# Altium schematic sheet SPSU_2.SchDoc: SPSU
size 292 x 217 mm; PCB_VERSION: V3.0; Origin: Eagle; Date: 12/02/2024 2:33:38 pm; SheetNumber: 3; SCHEMATIC_VERSION: SCHEMATIC_VERSION; GateName_1: G$1; SymbolName_1: A4L-LOC; LibraryName: frames_corvus; DeviceSetName: A4L-LOC; Sheet: Sheet:
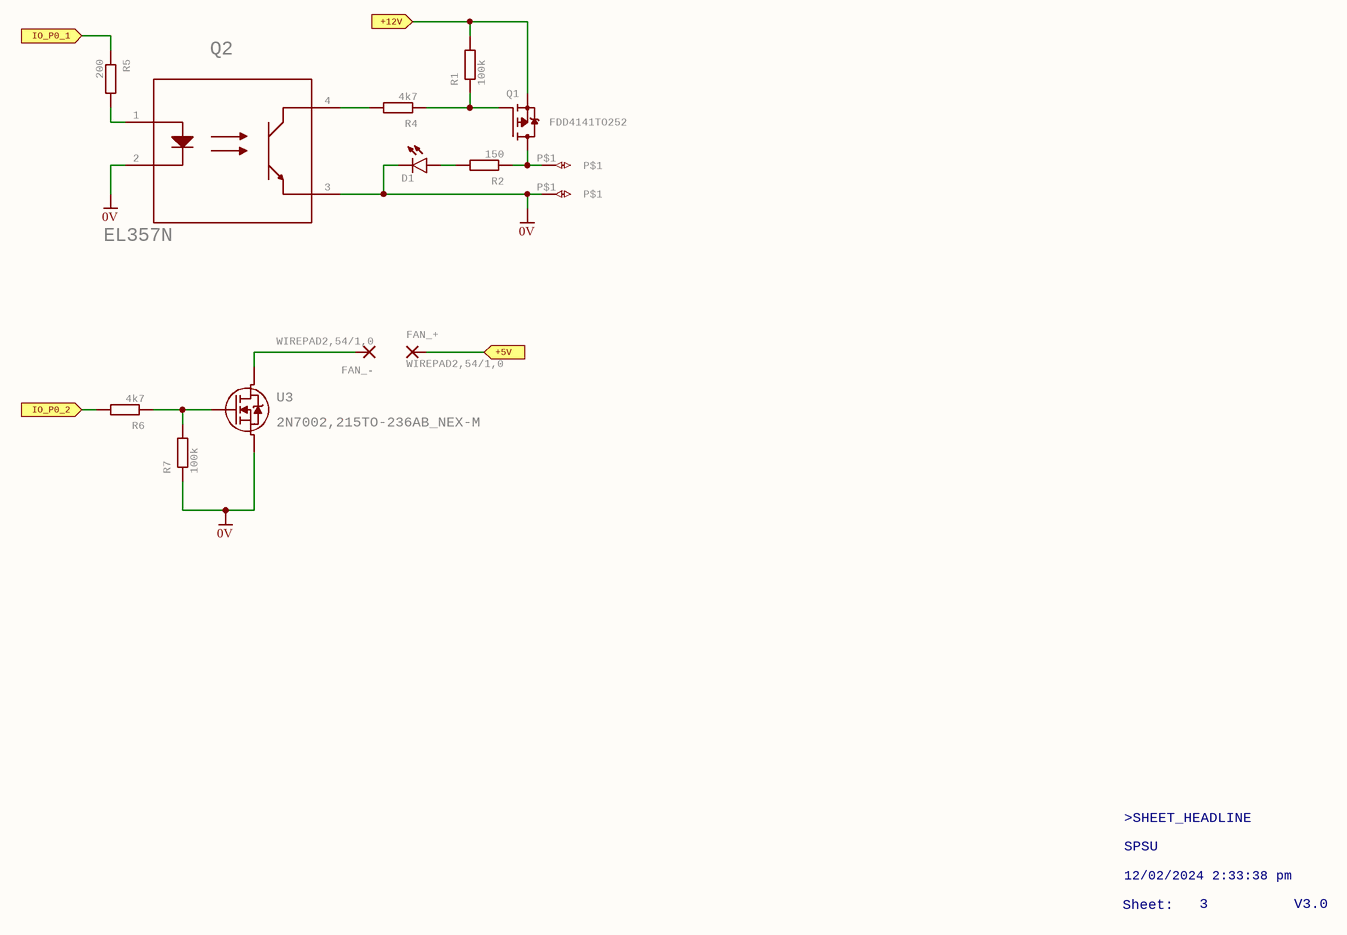
[diagram p0: SPSU_2.SchDoc]

## Parts
D1  LEDCHIPLED_0805  [CHIPLED_0805]  (value not drawn)
ESC+  ESC  [ESC]  (value not drawn)
ESC-  ESC  [ESC]  (value not drawn)
FAN_+  WIREPAD2,54/1,0  [2,54/1,0]
FAN_-  WIREPAD2,54/1,0  [2,54/1,0]
Q1  FDD4141TO252  [TO252]
Q2  EL357N  [EL357N(C)(TA)-VG_EVE-L]
R1  100k  [R0603]
R2  150  [R0603]
R4  4k7  [R0603]
R5  200  [R0603]
R6  4k7  [R0603]
R7  100k  [R0603]
U3  2N7002,215TO-236AB_NEX-M  [TO-236AB_NEX-M]

## Ports
+5V (in), +12V (in), IO_P0_1 (in), IO_P0_2 (in)

## Nets
0V: D1.C ESC-.P$1 Q2.2 Q2.3 R7.1 U3.2
+5V: FAN_+.1(P) ; port +5V
+12V: Q1.2(S) R1.2 ; port +12V
IO_P0_1: R5.1 ; port IO_P0_1
IO_P0_2: R6.2 ; port IO_P0_2
NetD1_A: D1.A R2.2
NetESC+_P$1: ESC+.P$1 Q1.3(D) R2.1
NetFAN_-_1: FAN_-.1(P) U3.3
NetQ1_1: Q1.1(G) R1.1 R4.1
NetQ2_1: Q2.1 R5.2
NetQ2_4: Q2.4 R4.2
NetR6_1: R6.1 R7.2 U3.1

## Notes on the sheet
- >SHEET_HEADLINE
- Sheet:
- SPSU
- 12/02/2024 2:33:38 pm
- 3
- V3.0

## Library data of the parts
D1 = LEDCHIPLED_0805: LED   OSRAM: - CHIPLED LG R971, LG N971, LY N971, LG Q971, LY Q971, LO R971, LY R971 LH N974, LH R974 LS Q976, LO Q976, LY Q976 LO Q996 - Hyper CHIPLED LW Q18S LB Q993, LB Q99A, LB R99A - SideLED LS A670, LO A670, LY A670, LG A670, LP A670 LB A673, LV A673, LT A673, LW A673 LH A674 LY A675 LS A676, LA A676, LO A676, LY A676, LW A676 LS A679, LY A679, LG A679 -  Hyper Micro SIDELEDÂ® LS Y876, LA Y876, LO Y876, LY Y876 LT Y87S - SmartLED LW L88C, LW L88S LB L89C, LB L89S, LG L890 LS L89K, LO L89K, LY L89K LS L896, LA L896, LO L896, LY L896 - TOPLED LS T670, LO T670, LY T670, LG T670, LP T670 LSG T670, LSP T670, LSY T670, LOP T670, LYG T670 LG T671, LOG T671, LSG T671 LB T673, LV T673, LT T673, LW T673 LH T674 LS T676, LA T676, LO T676, LY T676, LB T676, LH T676, LSB T676, LW T676 LB T67C, LV T67C, LT T67C, LS T67K, LO T67K, LY T67K, LW E67C LS E67B, LA E67B, LO E67B, LY E67B, LB E67C, LV E67C, LT E67C LW T67C LS T679, LY T679, LG T679 LS T770, LO T770, LY T770, LG T770, LP T770 LB T773, LV T773, LT T773, LW T773 LH T774 LS E675, LA E675, LY E675, LS T675 LS T776, LA T776, LO T776, LY T776, LB T776 LHGB T686 LT T68C, LB T68C - Hyper Mini TOPLEDÂ® LB M676 - Mini TOPLED SantanaÂ® LG M470 LS M47K, LO M47K, LY M47K    Source: http://www.osram.convergy.de   LUXEON: - LUMILEDÂ® LXK2-PW12-R00, LXK2-PW12-S00, LXK2-PW14-U00, LXK2-PW14-V00 LXK2-PM12-R00, LXK2-PM12-S00, LXK2-PM14-U00 LXK2-PE12-Q00, LXK2-PE12-R00, LXK2-PE12-S00, LXK2-PE14-T00, LXK2-PE14-U00 LXK2-PB12-K00, LXK2-PB12-L00, LXK2-PB12-M00, LXK2-PB14-N00, LXK2-PB14-P00, LXK2-PB14-Q00 LXK2-PR12-L00, LXK2-PR12-M00, LXK2-PR14-Q00, LXK2-PR14-R00 LXK2-PD12-Q00, LXK2-PD12-R00, LXK2-PD12-S00 LXK2-PH12-R00, LXK2-PH12-S00 LXK2-PL12-P00, LXK2-PL12-Q00, LXK2-PL12-R00    Source: www.luxeon.com   KINGBRIGHT:   KA-3528ASYC Source: www.kingbright.com; GateName_1: G$1; POPULARITY: 52; SymbolName_1: LED; DeviceName: CHIPLED_0805; LibraryName: led_CUSTOM; DeviceSetName: LED
ESC+ ESC- = ESC: GateName_1: G$1; SymbolName_1: ESC; LibraryName: corvus; DeviceSetName: ESC
FAN_+ FAN_- = WIREPAD2,54/1,0: Wire PAD connect wire on PCB; GateName_1: G$1; POPULARITY: 4; SymbolName_1: PAD; DeviceName: 2,54/1,0; LibraryName: wirepad; DeviceSetName: WIREPAD
Q1 = FDD4141TO252: P-Channel PowerTrenchÂ® MOSFET   Source:  FDD4141.pdf; GateName_1: G$1; SymbolName_1: P-MOSFET; POPULARITY: 3; DeviceName: TO252; LibraryName: transistor-fet; DeviceSetName: FDD4141
Q2 = EL357N(C)(TA)-VGEL357N(C)(TA)-VG_EVE-L: MFR_NAME: Everlight; GateName_1: A; SymbolName_1: OPTOCOUPLER_1A_2C_3E_4C; DeviceName: EL357N(C)(TA)-VG_EVE-L; LibraryName: EL357N; DeviceSetName: EL357N(C)(TA)-VG; COPYRIGHT: Copyright (C) 2022 Ultra Librarian. All rights reserved.; DIGI-KEY_PART_NUMBER_1: 1080-1601-2-ND; DIGI-KEY_PART_NUMBER_2: 1080-1601-1-ND; DIGI-KEY_PART_NUMBER_3: 1080-1601-6-ND; MANUFACTURER_PART_NUMBER: EL357N(C)(TA)-VG
R1 R4 R6 R7 = R_0603: GateName_1: >R_NAME$1; SymbolName_1: R-EU; LibraryName: corvus_RC; DeviceSetName: R_0603
  R1 R7: FARNELL: 2447226
  R4 R6: FARNELL: 2447385
R2 R5 = R-EU_R0603: RESISTOR, European symbol; GateName_1: G$1; SymbolName_1: R-EU; DeviceSetName: R-EU_; POPULARITY: 70; DeviceName: R0603; LibraryName: rcl_CUSTOM; SPICEPREFIX: R
U3 = 2N7002,215TO-236AB_NEX-M: MFR_NAME: Nexperia; GateName_1: A; SymbolName_1: TRANS_S; DeviceName: TO-236AB_NEX-M; LibraryName: 2n7002; DeviceSetName: 2N7002,215; COPYRIGHT: Copyright (C) 2022 Ultra Librarian. All rights reserved.; MANUFACTURER_PART_NUMBER: 2N7002,215